# Altium schematic sheet 20通道传感器-蓝牙主机2.0.0.SchDoc
size 594 x 420 mm; SPICEModelCacheAQFHFGVL: <root> / <DocumentId>AQFHFGVL</DocumentId> / <CacheFrame Number="0"> / <Model Name="xtal" Kind="CKT"> / <Text>*Generic type:crystal pkg:HC33/51 / .SUBCKT XTAL 1 2 PARAMS: FREQ=1Meg RS=750 C=13pf Q=1000 / LX 1 3 {((Q*RS)/(6.2831852*FREQ))} IC=0.5M / CX 3 4 {(1/(Q*6.2831852*FREQ*RS))} / C0 1 2 {C} / RS 4 2 {RS} / .ENDS XTAL</Text> / </Model> / </CacheFrame> / </root>
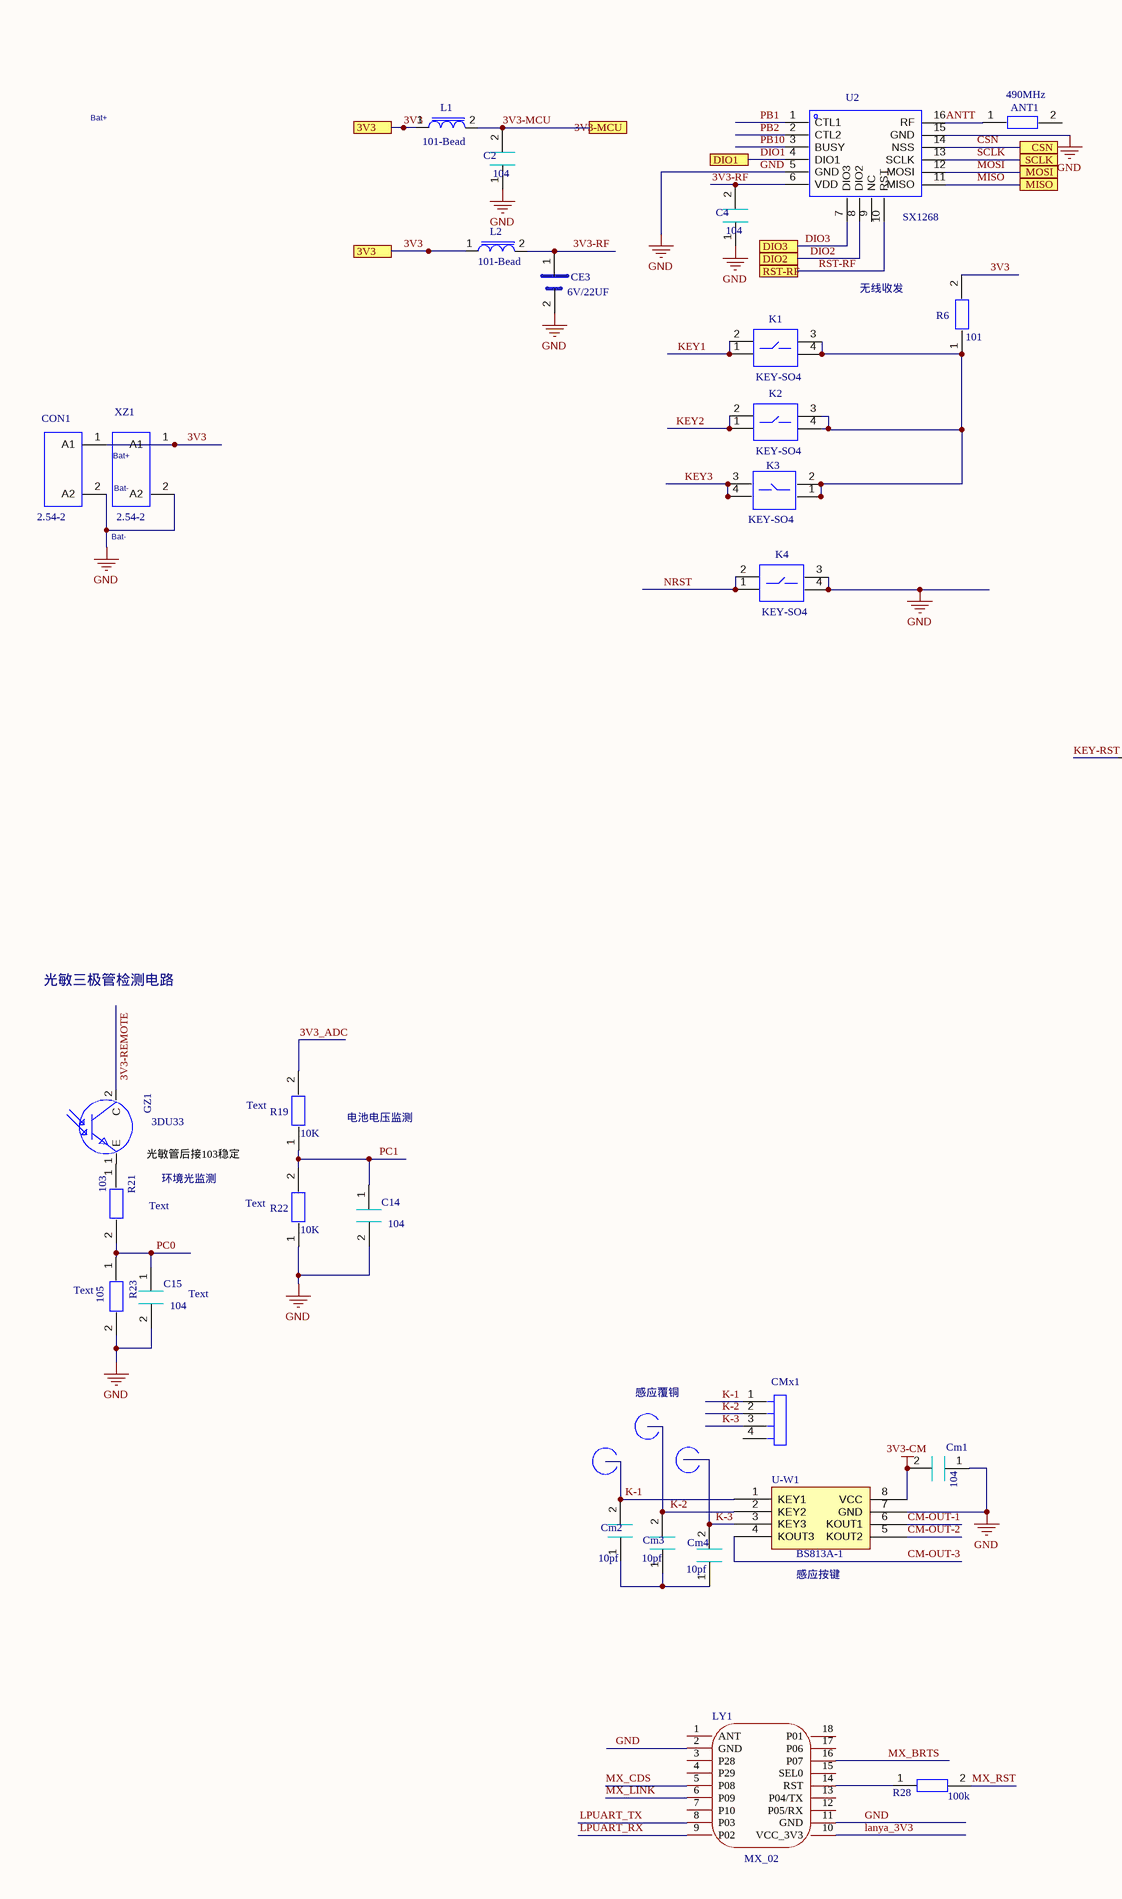
[diagram p0: 20通道传感器-蓝牙主机2.0.0.SchDoc, left]
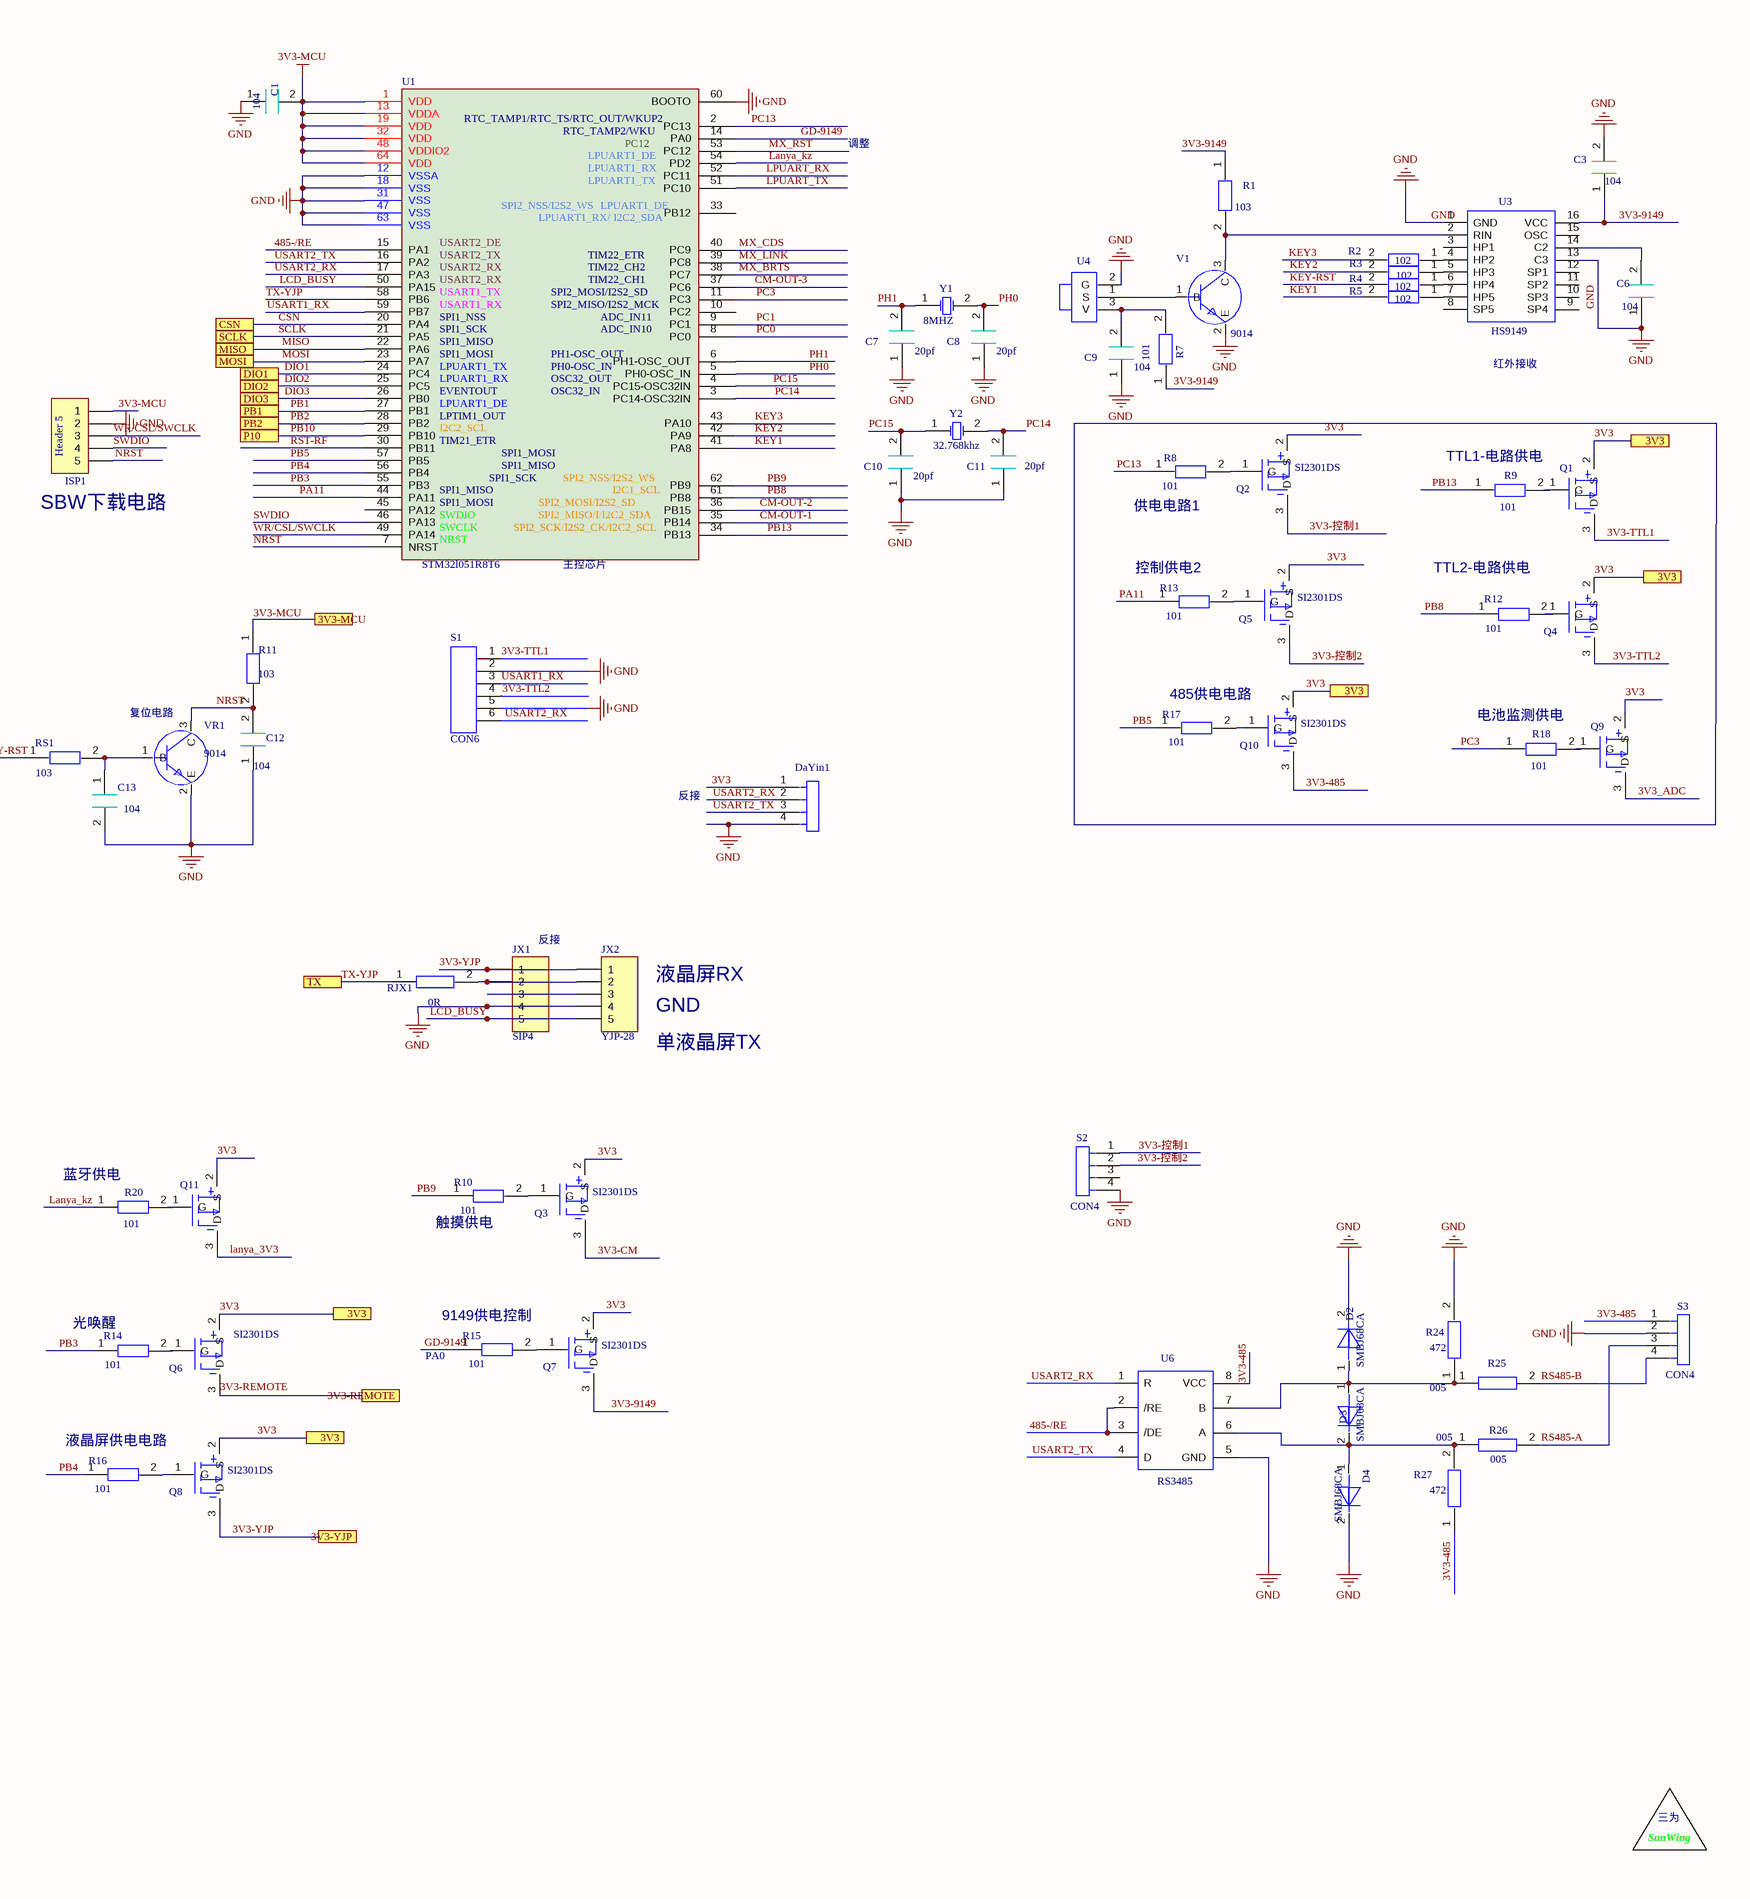
[diagram p1: 20通道传感器-蓝牙主机2.0.0.SchDoc, right]

## Parts
ANT1  490MHz  [TX-470-B]
C1  104  [0805C]
C2  104  [0805C]
C3  104  [0805C]
C4  104  [0805C]
C6  104  [0805C]
C7  20pf  [0805C]
C8  20pf  [0805C]
C9  104  [0805C]
C10  20pf  [0805C]
C11  20pf  [0805C]
C12  104  [0805C]
C13  104  [0805C]
C14  104  [0805C]
C15  104  [0805C]
CE3  6V/22UF  [1210C]
Cm1  104  [0805C]
Cm2  10pf  [0805C]
Cm3  10pf  [0805C]
Cm4  10pf  [0805C]
CMx1  (no value)  [HDR1X4]
CON1  2.54-2  [5.08HEADER1X2]
D2  SMBJ68CA  [SMB]
D3  SMBJ68CA  [SMB]
D4  SMBJ68CA  [SMB]
DaYin1  (no value)  [HDR1X4]
GZ1  3DU33  [3DU33]
ISP1  Header 5  [HDR1X5]
JX1  SIP4  [HDR1X4]
JX2  YJP-28  [YJP-28]
K1  KEY-SO4  [KEY-6X6-12/34]
K2  KEY-SO4  [KEY-6X6-12/34]
K3  KEY-SO4  [KEY-6X6-12/34]
K4  KEY-SO4  [KEY-6X6-12/34]
L1  101-Bead  [0805L]
L2  101-Bead  [0805L]
LY1  MX_02  [MX_02]
Q1  SI2301DS  [SOT-23-123]  (value not drawn)
Q2  SI2301DS  [SOT-23-123]
Q3  SI2301DS  [SOT-23-123]
Q4  SI2301DS  [SOT-23-123]  (value not drawn)
Q5  SI2301DS  [SOT-23-123]
Q6  SI2301DS  [SOT-23-123]
Q7  SI2301DS  [SOT-23-123]
Q8  SI2301DS  [SOT-23-123]
Q9  SI2301DS  [SOT-23-123]  (value not drawn)
Q10  SI2301DS  [SOT-23-123]
Q11  SI2301DS  [SOT-23-123]  (value not drawn)
R1  103  [0805R]
R2  102  [0805R]
R3  102  [0805R]
R4  102  [0805R]
R5  102  [0805R]
R6  101  [0805R]
R7  101  [0805R]
R8  101  [0805R]
R9  101  [0805R]
R10  101  [0805R]
R11  103  [0805R]
R12  101  [0805R]
R13  101  [0805R]
R14  101  [0805R]
R15  101  [0805R]
R16  101  [0805R]
R17  101  [0805R]
R18  101  [0805R]
R19  10K  [0805R]
R20  101  [0805R]
R21  103  [0805R]
R22  10K  [0805R]
R23  105  [0805R]
R24  472  [0805R]
R25  005  [0805R]
R26  005  [0805R]
R27  472  [0805R]
R28  100k  [0805R]
RJX1  0R  [DJ6MIL]
RS1  103  [0805R]
S1  CON6  [2.54-s-6]
S2  2.54-s-4  [2.54-s-4]  (value not drawn)
S3  5.08-4  [2.54-s-4]  (value not drawn)
singwing1  SUNWING  [sunwing]  (value not drawn)
U1  STM32l051R8T6  [LQFP-64_L10.0-W10.0-P0.50-LS12.0-BL]
U2  SX1268  [RF]
U3  HS9149  [SOP16]
U4  HS38BD  [HS/VS1838]  (value not drawn)
U6  RS3485  [SOP8]
U-W1  BS813A-1  [SOP8]
V1  9014  [SOT-23-123]
VR1  9014  [SOT-23-123]
XZ1  2.54-2  [2.54-2]
Y1  8MHZ  [OSC HC-49SMD]
Y2  32.768khz  [OSC-3x8-WI-B]

## Ports
3V3, 3V3-MCU, 3V3-REMOTE, 3V3-YJP, CSN, DIO1, DIO2, DIO3, MISO, MOSI, P10, PB1, PB2, RST-RF, SCLK, TX

## Nets
3V3-CM: Cm1.2 Q3.3(D) U-W1.8(VCC)
3V3-MCU: C1.2 C2.2 ISP1.1 L1.2 R11.1 U1.1(VDD) U1.13(VDDA) U1.19(VDD) U1.32(VDD) U1.48(VDDIO2) U1.64(VDD) ; port 3V3-MCU
GND: C1.1 C2.1 C3.2 C4.1 C6.1 C7.1 C8.1 C9.1 C10.1 C11.1 C12.1 C13.2 C14.2 C15.2 CE3.2 Cm1.1 CON1.2(A2) D2.2 D4.2 DaYin1.4 ISP1.2 JX1.4 JX2.4 K4.3 K4.4 LY1.2(GND) LY1.11(GND) R22.1 R23.2 R24.2 S1.2 S1.5 S2.4 S3.2 U1.12(VSSA) U1.18(VSS) U1.31(VSS) U1.47(VSS) U1.60(BOOTO) U1.63(VSS) U2.5(GND) U2.15(GND) U3.1(GND) U3.13(C3) U4.2(G) U6.5(GND) U-W1.7(GND) V1.2(E) VR1.2(E) XZ1.2(A2)
3V3: CON1.1(A1) DaYin1.1 L1.1 L2.1 Q1.2(S) Q2.2(S) Q3.2(S) Q4.2(S) Q5.2(S) Q6.2(S) Q7.2(S) Q8.2(S) Q9.2(S) Q10.2(S) Q11.2(S) R6.2 XZ1.1(A1) ; port 3V3
3V3-485: Q10.3(D) R27.1 S3.1 U6.8(VCC)
3V3-9149: C3.1 Q7.3(D) R1.1 R7.1 U3.16(VCC)
3V3-REMOTE: GZ1.2(C) Q6.3(D) ; port 3V3-REMOTE
3V3-RF: C4.2 CE3.1 L2.2 U2.6(VDD)
3V3-TTL1: Q1.3(D) S1.1
3V3-TTL2: Q4.3(D) S1.4
3V3-YJP: JX1.1 JX2.1 Q8.3(D) ; port 3V3-YJP
3V3-控制1: Q2.3(D) S2.1
3V3-控制2: Q5.3(D) S2.2
3V3_ADC: Q9.3(D) R19.2
485-/RE: U1.15(PA1) U6.2(/RE) U6.3(/DE)
ANTT: ANT1.1 U2.16(RF)
CM-OUT-1: U1.35(PB14) U-W1.6(KOUT1)
CM-OUT-2: U1.36(PB15) U-W1.5(KOUT2)
CM-OUT-3: U1.37(PC6) U-W1.4(KOUT3)
CSN: U1.20(PA4) U2.14(NSS) ; port CSN
DIO1: U1.24(PC4) U2.4(DIO1) ; port DIO1
DIO2: U1.25(PC5) U2.8(DIO2) ; port DIO2
DIO3: U1.26(PB0) U2.7(DIO3) ; port DIO3
GD-9149: R15.1 U1.14(PA0)
K-1: Cm2.2 CMx1.1 U-W1.1(KEY1)
K-2: Cm3.2 CMx1.2 U-W1.2(KEY2)
K-3: Cm4.2 CMx1.3 U-W1.3(KEY3)
KEY1: K1.1 K1.2 R5.2 U1.41(PA8)
KEY2: K2.1 K2.2 R3.2 U1.42(PA9)
KEY3: K3.3 K3.4 R2.2 U1.43(PA10)
KEY-RST: R4.2 RS1.1
lanya_3V3: LY1.10(VCC_3V3) Q11.3(D)
Lanya_kz: R20.1 U1.54(PD2)
LCD_BUSY: JX1.5 JX2.5 U1.50(PA15)
LPUART_RX: LY1.9(P02) U1.52(PC11)
LPUART_TX: LY1.8(P03) U1.51(PC10)
MISO: U1.22(PA6) U2.11(MISO) ; port MISO
MOSI: U1.23(PA7) U2.12(MOSI) ; port MOSI
MX_BRTS: LY1.16(P07) U1.38(PC7)
MX_CDS: LY1.5(P08) U1.40(PC9)
MX_LINK: LY1.6(P09) U1.39(PC8)
MX_RST: R28.2 U1.53(PC12)
NRST: C12.2 ISP1.5 K4.1 K4.2 R11.2 U1.7(NRST) VR1.3(C)
PA11: R13.1 U1.44(PA11)
PB1: U1.27(PB1) U2.1(CTL1) ; port PB1
PB2: U1.28(PB2) U2.2(CTL2) ; port PB2
PB3: R14.1 U1.55(PB3)
PB4: R16.1 U1.56(PB4)
PB5: R17.1 U1.57(PB5)
PB8: R12.1 U1.61(PB8)
PB9: R10.1 U1.62(PB9)
PB10: U1.29(PB10) U2.3(BUSY) ; port P10
PB13: R9.1 U1.34(PB13)
PC0: C15.1 R21.2 R23.1 U1.8(PC0)
PC1: C14.1 R19.1 R22.2 U1.9(PC1)
PC3: R18.1 U1.11(PC3)
PC13: R8.1 U1.2(PC13)
PC14: C11.2 U1.3(PC14-OSC32IN) Y2.2(OSC2)
PC15: C10.2 U1.4(PC15-OSC32IN) Y2.1(OSC1)
PH0: C8.2 U1.5(PH0-OSC_IN) Y1.2(OSC2)
PH1: C7.2 U1.6(PH1-OSC_OUT) Y1.1(OSC1)
RS485-A: R26.2 S3.3
RS485-B: R25.2 S3.4
RST-RF: U1.30(PB11) U2.10(RST) ; port RST-RF
SCLK: U1.21(PA5) U2.13(SCLK) ; port SCLK
SWDIO: ISP1.4 U1.46(PA13)
TX-YJP: RJX1.1 U1.58(PB6) ; port TX
USART1_RX: S1.3 U1.59(PB7)
USART2_RX: DaYin1.2 S1.6 U1.17(PA3) U6.1(R)
USART2_TX: DaYin1.3 U1.16(PA2) U6.4(D)
WR/CSL/SWCLK: ISP1.3 U1.49(PA14)
NetC6_2: C6.2 U3.14(C2)
NetC9_2: C9.2 R7.2 U4.3(V)
NetC13_1: C13.1 RS1.2 VR1.1(B)
NetCm2_1: Cm2.1 Cm3.1 Cm4.1
NetD2_1: D2.1 D3.1 R24.1 R25.1 U6.7(B)
NetD3_2: D3.2 D4.1 R26.1 R27.2 U6.6(A)
NetGZ1_1: GZ1.1(E) R21.1
NetJX1_2: JX1.2 JX2.2 RJX1.2
NetJX1_3: JX1.3 JX2.3
NetK1_3: K1.3 K1.4 K2.3 K2.4 K3.1 K3.2 R6.1
NetLY1_14: LY1.14(RST) R28.1
NetQ1_1: Q1.1(G) R9.2
NetQ2_1: Q2.1(G) R8.2
NetQ3_1: Q3.1(G) R10.2
NetQ4_1: Q4.1(G) R12.2
NetQ5_1: Q5.1(G) R13.2
NetQ6_1: Q6.1(G) R14.2
NetQ7_1: Q7.1(G) R15.2
NetQ8_1: Q8.1(G) R16.2
NetQ9_1: Q9.1(G) R18.2
NetQ10_1: Q10.1(G) R17.2
NetQ11_1: Q11.1(G) R20.2
NetR1_2: R1.2 U3.2(RIN) V1.3(C)
NetR2_1: R2.1 U3.4(HP2)
NetR3_1: R3.1 U3.5(HP3)
NetR4_1: R4.1 U3.6(HP4)
NetR5_1: R5.1 U3.7(HP5)
NetU4_1: U4.1(S) V1.1(B)

Not connected (* = marked no-connect by the designer): ANT1 2; CMx1 4; LY1 1(ANT) 3(P28) 4(P29) 7(P10) 12(P05/RX) 13(P04/TX) 15(SEL0) 17(P06) 18(P01); S2 3; U1 10(PC2) 33(PB12) 45(PA12); U2 9(NC); U3 3(HP1) 8(SP5) 9(SP4) 10(SP3) 11(SP2) 12(SP1) 15(OSC)

## Notes on the sheet
- Bat+
- 调整
- 无线收发
- 红外接收
- (near R9) TTL1-电路供电
- Bat-
- (near ISP1) SBW下载电路
- (near R8) 供电电路1
- (near U1) 主控芯片
- (near R13) 控制供电2
- (near R12) TTL2-电路供电
- (near VR1) 复位电路
- (near R17) 485供电电路
- (near R18) 电池监测供电
- 反接
- (near JX1) 反接
- 液晶屏RX
- 光敏三极管检测电路
- GND
- 单液晶屏TX
- 光敏管后接103稳定
- (near R19) Text
- (near R19) 电池电压监测
- (near R21) Text
- 环境光监测
- (near R22) Text
- (near R20) 蓝牙供电
- (near R10) 触摸供电
- (near R23) Text
- (near C15) Text
- (near R14) 光唤醒
- (near R15) 9149供电控制
- 感应覆铜
- (near R15) PA0
- (near R16) 液晶屏供电电路
- (near U-W1) 感应按键
- Labels drawn without touching a wire or pin: 3.3V, GND
- DWG NO:
- REV:
- THIS DOCUMENT AND THE DATA DISCLOSED HEREIN OR
- HEREWITH IS THE PROPERTY OF ALTIUM LIMITED AND MAY
- BE FREELY DISTRIBUTED IN WHOLE. NO RIGHTS ARE
- RESERVED OR EXPRESS OR IMPLIED WARANTEE GIVEN.
- REVISION
- DESCRIPTION
- DATE
- APPROVED
- ENG:
- APPROVALS
- PROJECT
- DSN:
- CHK:
- REFERENCE DOCUMENTS
- PROJECT REVISION:
- TITLE
- DOCUMENT REVISION:
- DESIGN ITEM:
- BOM:
- FAB DWG:
- PCB DWG:
- ASSY DWG:
- SCALE:
- A2
- SIZE
- CAGE CODE
- FILE NAME
- DWG NO.
- SHEET
- OF
- REV
- (in symbol stm32l051R8t6_1) RTC_TAMP1/RTC_TS/RTC_OUT/WKUP2; RTC_TAMP2/WKU; LPUART1_DE; LPUART1_RX; LPUART1_TX; SPI2_NSS/I2S2_WS; LPUART1_RX/ I2C2_SDA; USART2_DE; USART2_TX; TIM22_ETR; USART2_RX; TIM22_CH2; TIM22_CH1; USART1_TX; SPI2_MOSI/I2S2_SD; USART1_RX; SPI2_MISO/I2S2_MCK; SPI1_NSS; ADC_IN11; SPI1_SCK; ADC_IN10; SPI1_MISO; SPI1_MOSI; OSC32_OUT; EVENTOUT; OSC32_IN; LPTIM1_OUT; I2C2_SCL; TIM21_ETR; I2C1_SCL; SWDIO; SPI2_MISO/I/I2C2_SDA; SWCLK; SPI2_SCK/I2S2_CK/I2C2_SCL
- (in symbol SUNWING) 三为; SunWing

## Library data of the parts
ANT1 R9 R11 R18 R20 = RES: PCB DECAL: 0603R
  ANT1: Value: 490MHz
  R9 R18 R20: Value: 101
  R11: Value: 103
C1-C4 C6-C15 Cm1-Cm4 = CAP: PCB DECAL: 0805C
CE3 = cap-d
CMx1 DaYin1 S3 = CON4: PCB DECAL: 5.08HEADER1X4; Comment_1: CON4
CON1 = CON2: PCB DECAL: 5.08HEADER1X2
D2-D4 = DIODE: PCB DECAL: DIODESMD; Value: SMBJ68CA
ISP1 = Header 5: Header, 5-Pin; LatestRevisionDate: 17-Jul-2002; LatestRevisionNote: Re-released for DXP Platform.; Publisher: Altium Limited
JX1 JX2 = MHDR1X5: Header, 5-Pin; LatestRevisionDate: 17-Jul-2002; LatestRevisionNote: Re-released for DXP Platform.; Publisher: Altium Limited
K1-K4 = KEY: PCB DECAL: KEY-4
L1 L2 = INDUCTOR: PCB DECAL: 0805R; Value: 101-Bead
LY1 = mx_02: Add into BOM: yes; Symbol: mx_02; Device: mx_02; Convert to PCB: yes
Q1-Q11 = MOFET-P: PCB DECAL: SOT-23; Value: SI2301DS
R1-R7 R12 R19 R22 R24 R27 RS1 = RES: PCB DECAL: 0805R
  R1 RS1: Value: 103
  R2-R5: Value: 102
  R6 R7 R12: Value: 101
  R19 R22: Value: 10K
  R24 R27: Value: 472
R8 R10 R13-R17 R21 R23 R28 = RES: Value: 102; PCB DECAL: 0805R
R25 R26 = RES: Value: PTC; PCB DECAL: 005
RJX1 = RES: Value: 0; PCB DECAL: 0805R
S2 = CON4: PCB DECAL: 2.54-s-4; CON4: CON4
U1 = stm32l051R8t6_1: ComponentLink1Description: New link; ComponentLink1URL: *; ComponentLink2Description: New link 1; ComponentLink2URL: *
U3 = HS9149: PCB DECAL: SO-16; Value: hs9149
U4 = IR-ROMTE: PCB DECAL: INFRARED_RX
U6 = SN75LBC184: PCB DECAL: SO-8-A
U-W1 = SOP8: Supplier 1: Digikey
V1 VR1 = NPN: PCB DECAL: SOT-23
  V1: 2300: 9014
  VR1: Value: 9014
XZ1 = CON2: PCB DECAL: 5.08HEADER1X2
Y1 Y2 = XTAL: Crystal Oscillator; Published: 8-Jun-2000; LatestRevisionDate: 17-Jul-2002; LatestRevisionNote: Re-released for DXP Platform.; PackageReference: R38; Publisher: Altium Limited; PackageDescription: Crystal, Thru-Hole; 2 Leads; Body 3.1 x 8.2 mm (Dia.xH)
GZ1 = 3DU33: PCB DECAL: 3DU33